# EasyEDA Pro project ProPrj_TMI7003C_TEST—CHANGE_2025-05-07.epro

# Schematic Schematic1

## Sheets
1 P2: Board Name: Board1; Create Date: 2025-05-06; Page Name: P2; Project Name: TMI7003C_TEST—CHANGE; Schematic Name: Schematic1; Update Date: 2025-05-06; Company: 嘉立创EDA; Page Size: A4; Version: V1.0
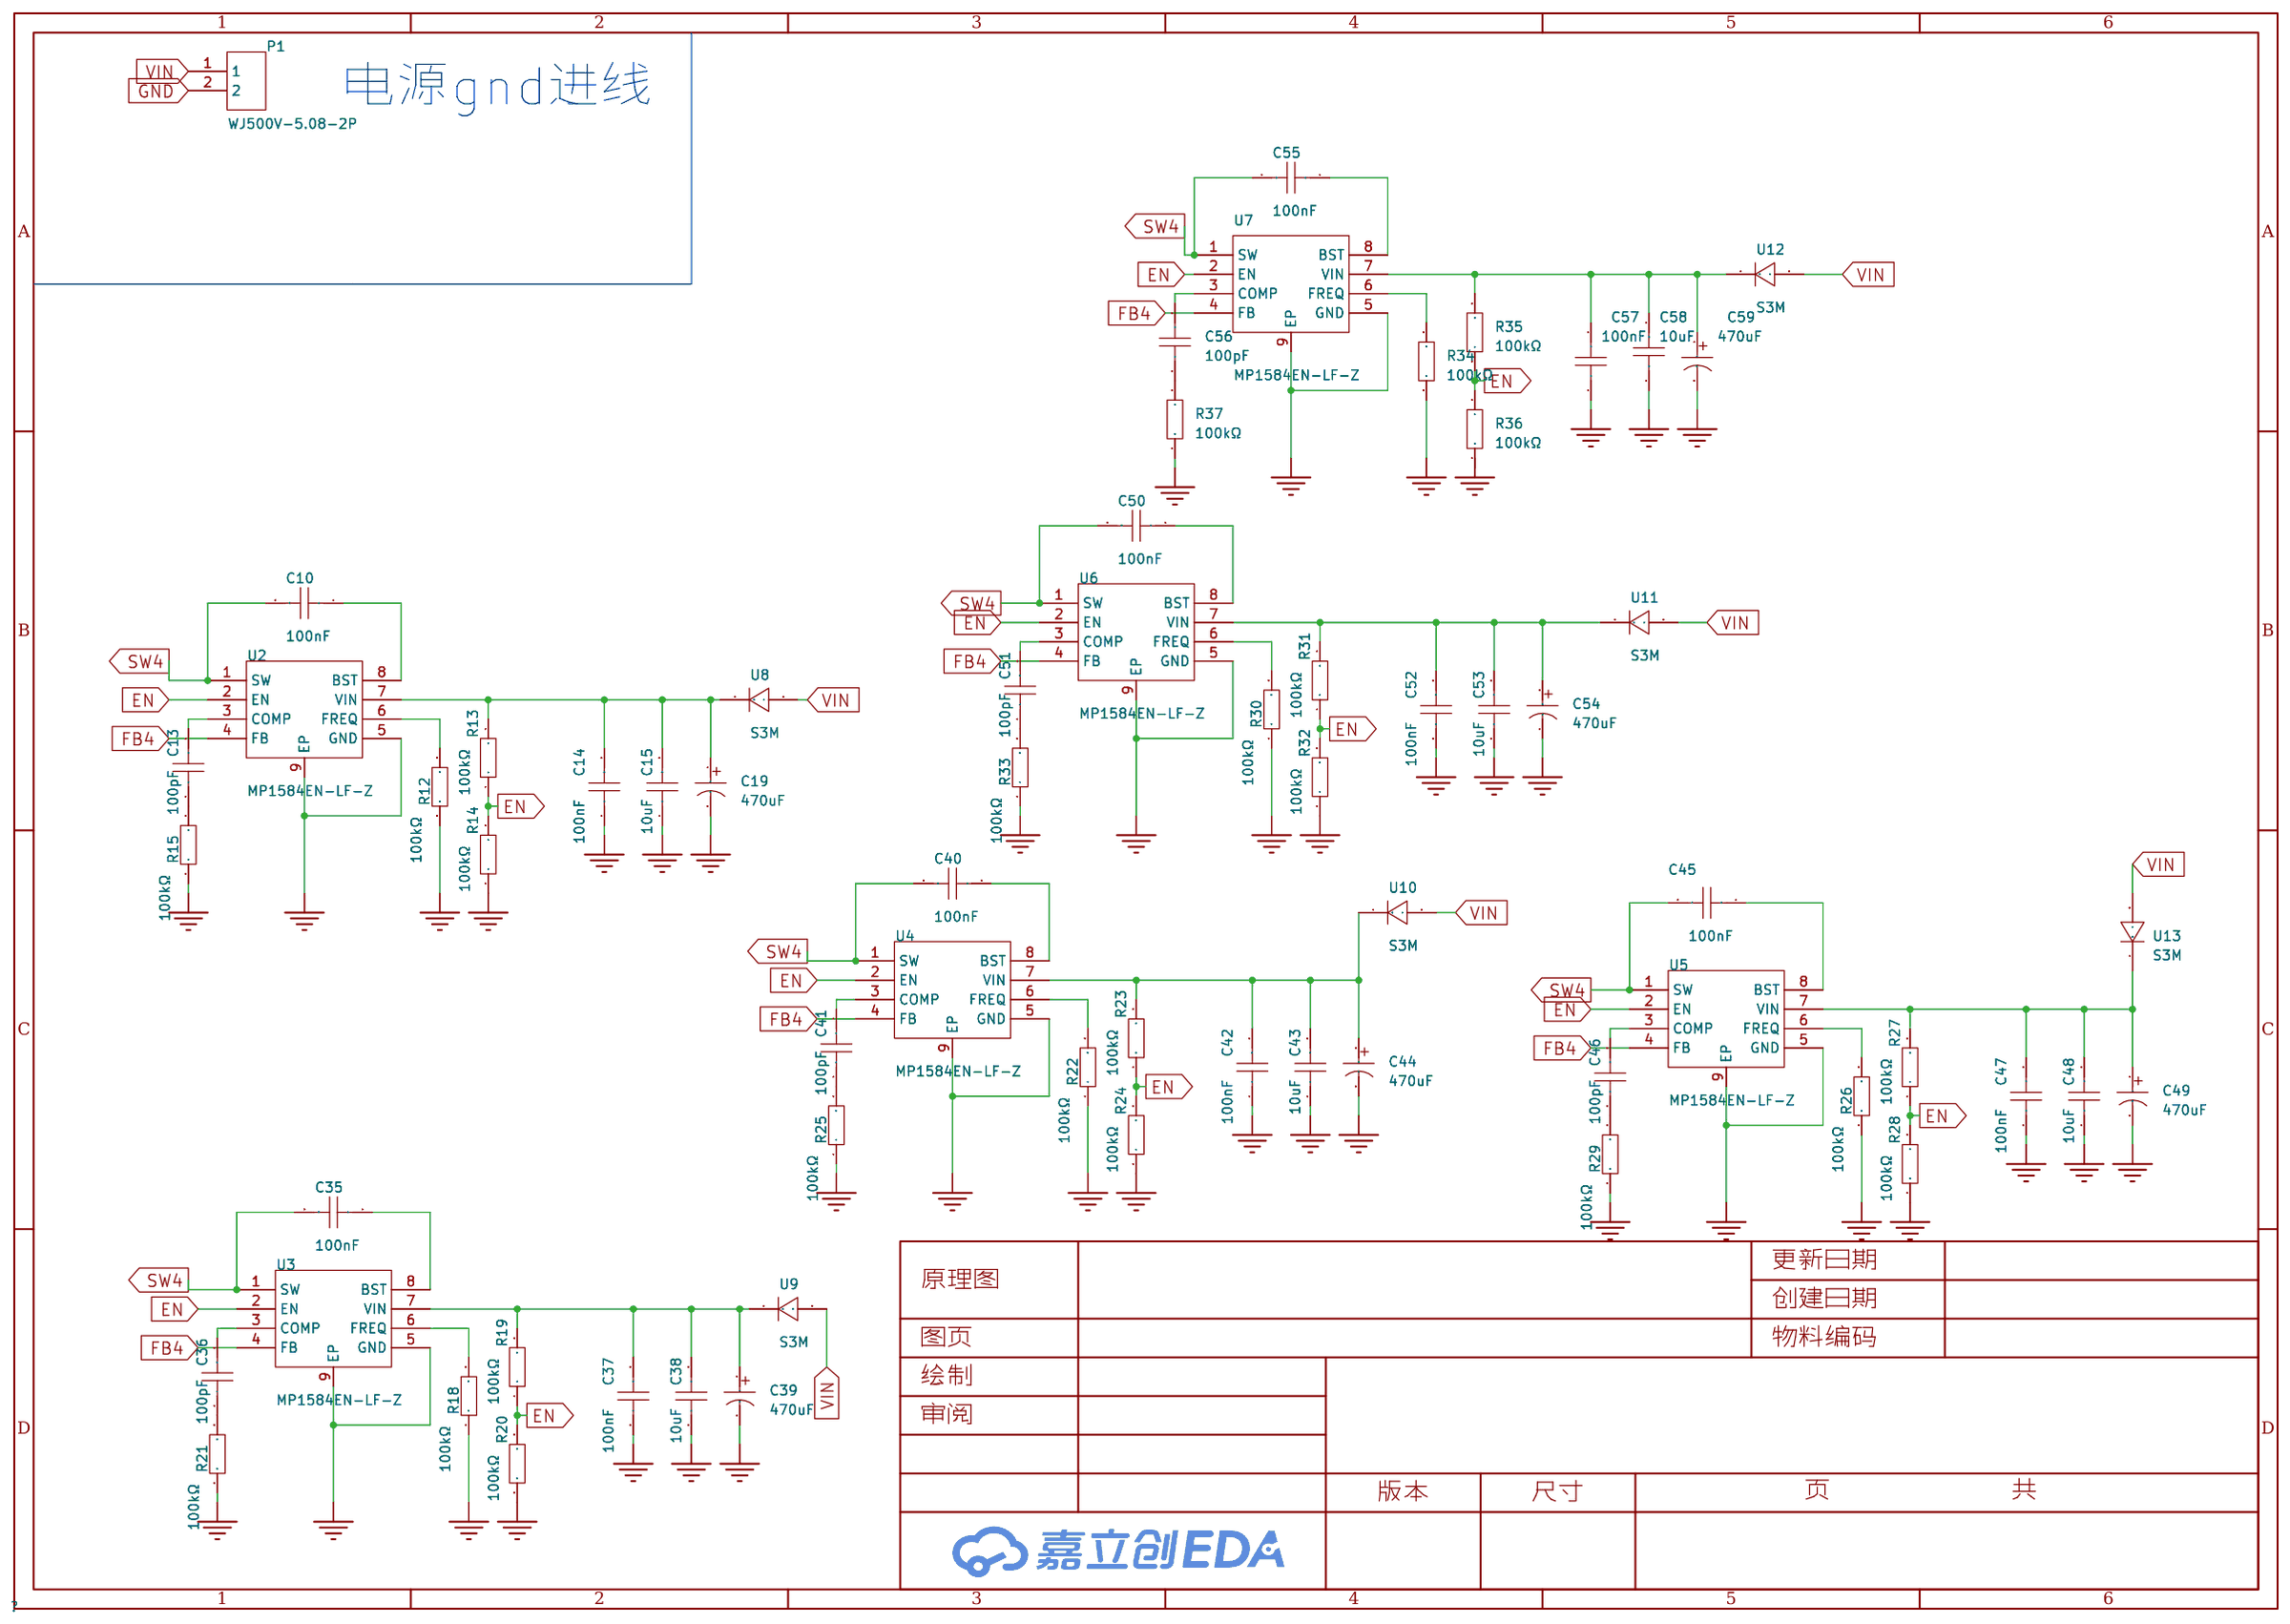
[diagram p0: P2]
2 P3: Page Name: P3
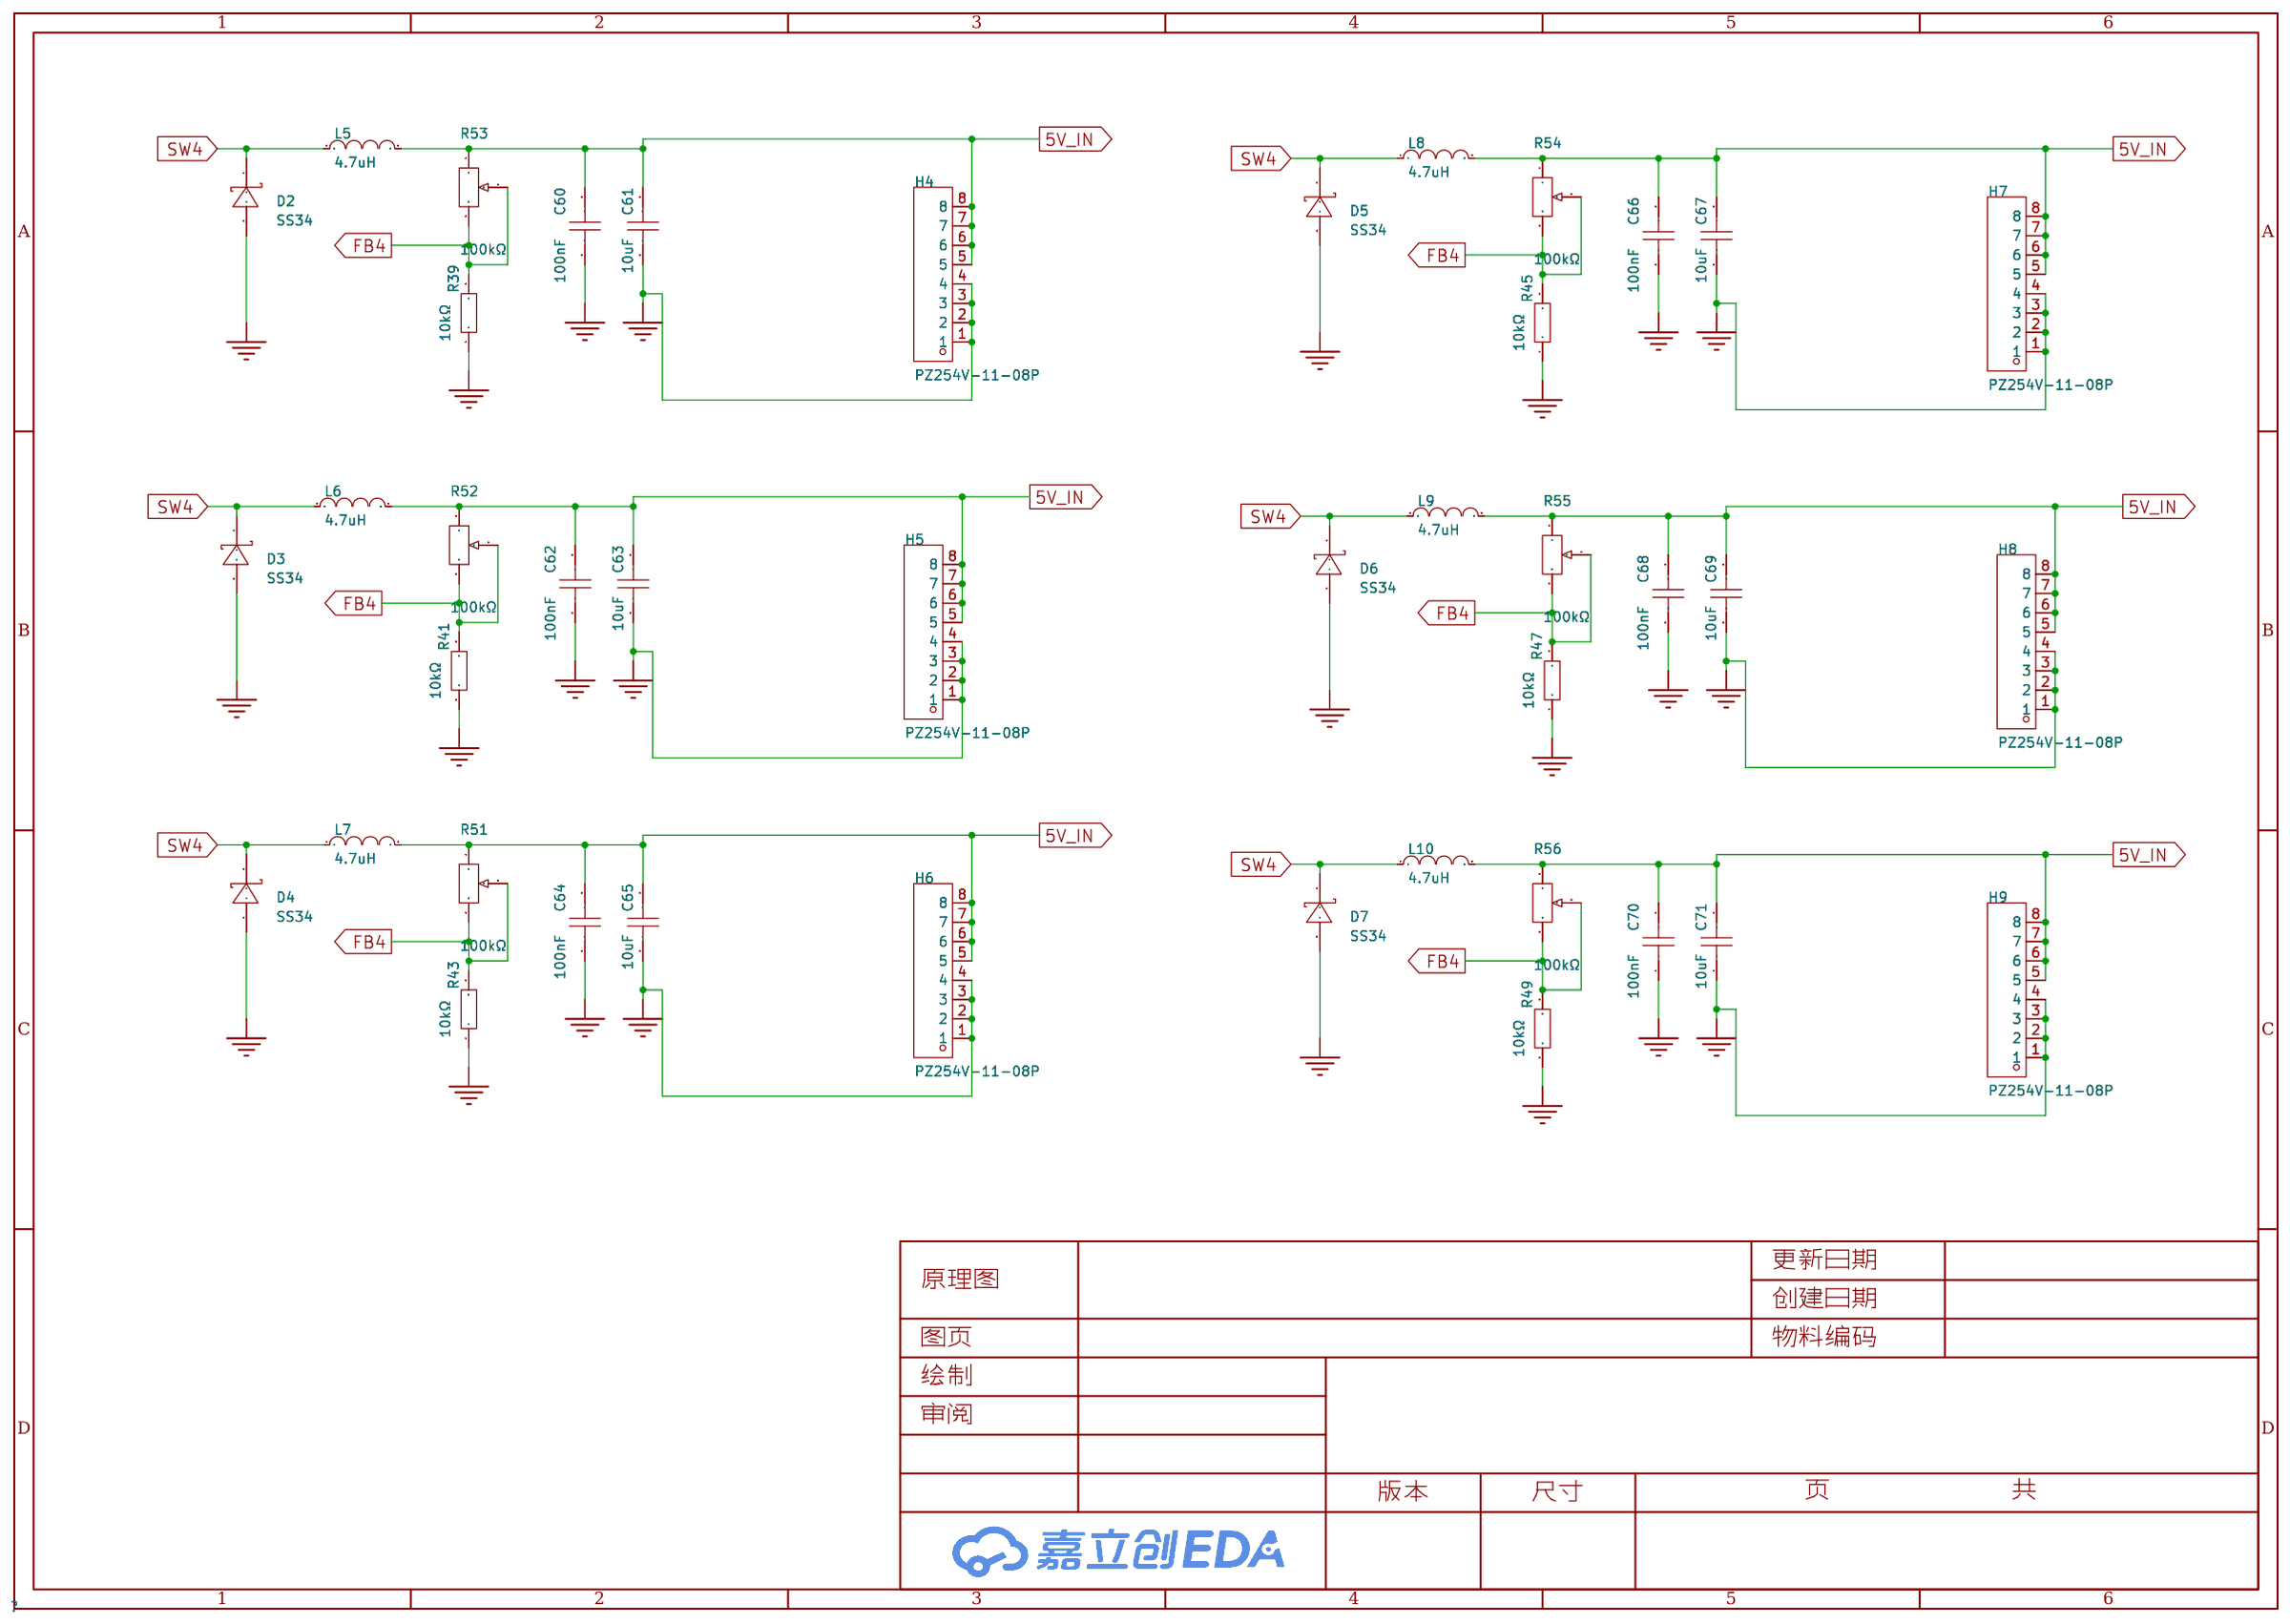
[diagram p1: P3]

## Parts
sheet P2
C10  100nF  [C0603]
C13  100pF  [C0603]
C14  100nF  [C0603]
C15  10uF  [C0603]
C19  470uF  [CAP-TH_BD10.0-P5.00-D1.0-FD]
C35  100nF  [C0603]
C36  100pF  [C0603]
C37  100nF  [C0603]
C38  10uF  [C0603]
C39  470uF  [CAP-TH_BD10.0-P5.00-D1.0-FD]
C40  100nF  [C0603]
C41  100pF  [C0603]
C42  100nF  [C0603]
C43  10uF  [C0603]
C44  470uF  [CAP-TH_BD10.0-P5.00-D1.0-FD]
C45  100nF  [C0603]
C46  100pF  [C0603]
C47  100nF  [C0603]
C48  10uF  [C0603]
C49  470uF  [CAP-TH_BD10.0-P5.00-D1.0-FD]
C50  100nF  [C0603]
C51  100pF  [C0603]
C52  100nF  [C0603]
C53  10uF  [C0603]
C54  470uF  [CAP-TH_BD10.0-P5.00-D1.0-FD]
C55  100nF  [C0603]
C56  100pF  [C0603]
C57  100nF  [C0603]
C58  10uF  [C0603]
C59  470uF  [CAP-TH_BD10.0-P5.00-D1.0-FD]
P1  WJ500V-5.08-2P  [CONN-TH_2P-P5.00_WJ500V-5.08-2P]
R12  100kΩ  [R0603]
R13  100kΩ  [R0603]
R14  100kΩ  [R0603]
R15  100kΩ  [R0603]
R18  100kΩ  [R0603]
R19  100kΩ  [R0603]
R20  100kΩ  [R0603]
R21  100kΩ  [R0603]
R22  100kΩ  [R0603]
R23  100kΩ  [R0603]
R24  100kΩ  [R0603]
R25  100kΩ  [R0603]
R26  100kΩ  [R0603]
R27  100kΩ  [R0603]
R28  100kΩ  [R0603]
R29  100kΩ  [R0603]
R30  100kΩ  [R0603]
R31  100kΩ  [R0603]
R32  100kΩ  [R0603]
R33  100kΩ  [R0603]
R34  100kΩ  [R0603]
R35  100kΩ  [R0603]
R36  100kΩ  [R0603]
R37  100kΩ  [R0603]
U2  MP1584EN-LF-Z  [SOIC-8_L5.0-W4.0-P1.27-LS6.0-BL-EP2.0]
U3  MP1584EN-LF-Z  [SOIC-8_L5.0-W4.0-P1.27-LS6.0-BL-EP2.0]
U4  MP1584EN-LF-Z  [SOIC-8_L5.0-W4.0-P1.27-LS6.0-BL-EP2.0]
U5  MP1584EN-LF-Z  [SOIC-8_L5.0-W4.0-P1.27-LS6.0-BL-EP2.0]
U6  MP1584EN-LF-Z  [SOIC-8_L5.0-W4.0-P1.27-LS6.0-BL-EP2.0]
U7  MP1584EN-LF-Z  [SOIC-8_L5.0-W4.0-P1.27-LS6.0-BL-EP2.0]
U8  S3M  [SMB_L4.3-W3.6-LS5.3-RD]
U9  S3M  [SMB_L4.3-W3.6-LS5.3-RD]
U10  S3M  [SMB_L4.3-W3.6-LS5.3-RD]
U11  S3M  [SMB_L4.3-W3.6-LS5.3-RD]
U12  S3M  [SMB_L4.3-W3.6-LS5.3-RD]
U13  S3M  [SMB_L4.3-W3.6-LS5.3-RD]
sheet P3
C60  100nF  [C0603]
C61  10uF  [C0603]
C62  100nF  [C0603]
C63  10uF  [C0603]
C64  100nF  [C0603]
C65  10uF  [C0603]
C66  100nF  [C0603]
C67  10uF  [C0603]
C68  100nF  [C0603]
C69  10uF  [C0603]
C70  100nF  [C0603]
C71  10uF  [C0603]
D2  SS34  [SMA_L4.3-W2.6-LS5.2-RD]
D3  SS34  [SMA_L4.3-W2.6-LS5.2-RD]
D4  SS34  [SMA_L4.3-W2.6-LS5.2-RD]
D5  SS34  [SMA_L4.3-W2.6-LS5.2-RD]
D6  SS34  [SMA_L4.3-W2.6-LS5.2-RD]
D7  SS34  [SMA_L4.3-W2.6-LS5.2-RD]
H4  PZ254V-11-08P  [HDR-TH_8P-P2.54-V-M]
H5  PZ254V-11-08P  [HDR-TH_8P-P2.54-V-M]
H6  PZ254V-11-08P  [HDR-TH_8P-P2.54-V-M]
H7  PZ254V-11-08P  [HDR-TH_8P-P2.54-V-M]
H8  PZ254V-11-08P  [HDR-TH_8P-P2.54-V-M]
H9  PZ254V-11-08P  [HDR-TH_8P-P2.54-V-M]
L5  4.7uH  [IND-SMD_L5.4-W5.2_FXL0530]
L6  4.7uH  [IND-SMD_L5.4-W5.2_FXL0530]
L7  4.7uH  [IND-SMD_L5.4-W5.2_FXL0530]
L8  4.7uH  [IND-SMD_L5.4-W5.2_FXL0530]
L9  4.7uH  [IND-SMD_L5.4-W5.2_FXL0530]
L10  4.7uH  [IND-SMD_L5.4-W5.2_FXL0530]
R39  10kΩ  [R0603]
R41  10kΩ  [R0603]
R43  10kΩ  [R0603]
R45  10kΩ  [R0603]
R47  10kΩ  [R0603]
R49  10kΩ  [R0603]
R51  100kΩ  [RES-ADJ-TH_3P-L9.5-W4.9-P2.50-L_3296W]
R52  100kΩ  [RES-ADJ-TH_3P-L9.5-W4.9-P2.50-L_3296W]
R53  100kΩ  [RES-ADJ-TH_3P-L9.5-W4.9-P2.50-L_3296W]
R54  100kΩ  [RES-ADJ-TH_3P-L9.5-W4.9-P2.50-L_3296W]
R55  100kΩ  [RES-ADJ-TH_3P-L9.5-W4.9-P2.50-L_3296W]
R56  100kΩ  [RES-ADJ-TH_3P-L9.5-W4.9-P2.50-L_3296W]

## Library data of the parts
C10 C14 C35 C37 C40 C42 C45 C47 C50 C52 C55 C57 C60 C62 C64 C66 C68 C70 = CGA0603X7R104K500JT: 容值:100nF;精度:±10%;额定电压:50V;材质(温度系数):X7R;; LCSC Part Name: 100nF ±10% 50V; Supplier Part: C6119867; Manufacturer: HRE(芯声); Supplier Footprint: 0603; JLCPCB Part Class: 扩展库; Supplier: LCSC; Tolerance: ±10%; Voltage Rated: 50V; Temperature Coefficient: X7R
C13 C36 C41 C46 C51 C56 = CC0603JRNPO9BN101: 容值:100pF;精度:±5%;额定电压:50V;材质(温度系数):NP0;; LCSC Part Name: 100pF ±5% 50V; Supplier Part: C14665; Manufacturer: YAGEO(国巨); Supplier Footprint: 0603; JLCPCB Part Class: 扩展库; Datasheet: https://atta.szlcsc.com/upload/public/pdf/source/20181008/C309499_21CC21451B82C39E3D92150FD6B30293.pdf; Supplier: LCSC; Tolerance: ±5%; Voltage Rated: 50V; Temperature Coefficient: NP0
C15 C38 C43 C48 C53 C58 C61 C63 C65 C67 C69 C71 = CGA0603X5R106K100JT: 容值:10uF;精度:±10%;额定电压:10V;材质(温度系数):X5R;; LCSC Part Name: 10uF ±10% 10V; Supplier Part: C6119842; Manufacturer: HRE(芯声); Supplier Footprint: 0603; JLCPCB Part Class: 扩展库; Supplier: LCSC; Tolerance: ±10%; Voltage Rated: 10V; Temperature Coefficient: X5R
C19 C39 C44 C49 C54 C59 = ERS1VM471G16OT: 容值:470uF;精度:±20%;额定电压:35V;; LCSC Part Name: 470uF ±20% 35V; Supplier Part: C106703; Manufacturer: AISHI(艾华集团); Supplier Footprint: 插件,D10xL16mm; JLCPCB Part Class: 扩展库; Datasheet: https://atta.szlcsc.com/upload/public/pdf/source/20191015/C438940_4B8E60A742BB0AE40DDEF87A5C89089D.pdf; Supplier: LCSC; Tolerance: ±20%; Voltage Rating: 35V; Pin Spacing: 5mm; Diameter: 10mm; Height - Seated (Max): 16mm; Lifetime: 7000hrs@105℃
P1 = WJ500V-5.08-2P: 结构:1x2P;间距:5.08mm;颜色:绿色;安装方式:直插;额定电流:18A;额定电压:250V;排数:1;线规 - AWG:14~30;线规 - 平方毫米:2.5;每排PIN数:2;触头材质:-;触头镀层:-;工作温度范围:-40℃~+105℃;焊接温度(最大值):-;; LCSC Part Name: 1x2P 5.08mm 直插 排数:1 每排P数:2; Supplier Part: C8465; Manufacturer: KANGNEX(康奈克斯电气); Supplier Footprint: 插件,P=5.08mm; JLCPCB Part Class: 扩展库; Datasheet: https://atta.szlcsc.com/upload/public/pdf/source/20191225/C8465_02D34CE5B5B4A53DF5891601D97FA9F4.pdf; Supplier: LCSC; Structure: 1x2P; Pitch: 5.08mm; Color: 绿色; Mounting Style: 直插; Current Rating (Max): 18A; Voltage Rating (Max): 250V; Number of Pins: 2P; Number of Rows: 1; Wire Gauge - AWG: 14~30; Wire Gauge - mm2: 2.5; Number of PINs Per Row: 2; Operating Temperature Range: -40℃~+105℃; Screw Specification: M2.5
R12-R15 R18-R37 R39 R41 R43 R45 R47 R49 = 0603WAF1003T5E: 电阻类型:厚膜电阻;阻值:100kΩ;精度:±1%;功率:100mW;最大工作电压:75V;温度系数:±100ppm/℃;; LCSC Part Name: 100kΩ ±1% 100mW 厚膜电阻; Supplier Part: C25803; Manufacturer: UNI-ROYAL(厚声); Supplier Footprint: 0603; JLCPCB Part Class: 基础库; Datasheet: https://atta.szlcsc.com/upload/public/pdf/source/20200306/C422600_1E6D84923E4A46A82E41ADD87F860B5C.pdf; Supplier: LCSC; Type: 厚膜电阻; Tolerance: ±1%; Power(Watts): 100mW; Overload Voltage (Max): 75V; Temperature Coefficient: ±100ppm/℃; Operating Temperature Range: -55℃~+155℃
U2-U7 = MP1584EN-LF-Z: 功能类型:降压型;输出类型:固定;工作电压:4.5V~28V;输出电压:800mV~25V;输出电流:3A;; LCSC Part Name: 3A、1.5MHz、28V降压转换器; Supplier Part: C15051; Manufacturer: MPS(芯源); Supplier Footprint: SOIC-8-EP; JLCPCB Part Class: 扩展库; Datasheet: https://atta.szlcsc.com/upload/public/pdf/source/20240315/437CA6FCECC7F1E554266F7D3B71CA0D.pdf; Supplier: LCSC; Function: 降压型; Output Type: 固定; Input Voltage: 4.5V~28V; Output Voltage: 800mV~25V; Output Current: 3A; Switching Frequency: 100kHz~1.5MHz; Operating Temperature: -20℃~+125℃; Synchronous Rectification: 否; Number of Outputs: 1; Topology: 降压式; Quiescent Current (Iq): 100uA; Switch tube (built-in/external): 内置
U8-U13 = S3M_C5204901: 二极管配置:独立式;正向压降(Vf):1.1V@3A;直流反向耐压(Vr):1kV;整流电流:3A;; Supplier Part: C5204901; Manufacturer: TWGMC(台湾迪嘉); Supplier Footprint: SMB; JLCPCB Part Class: 扩展库; Datasheet: https://atta.szlcsc.com/upload/public/pdf/source/20221031/21978DBEFD3E170414161A278DB5CF20.pdf; Supplier: LCSC; Diode Configuration: 独立式; Forward Voltage (Vf@If): 1.1V@3A; Reverse Voltage (Vr): 1kV; Rectified Current: 3A; Reverse Leakage Current (Ir): 5uA
D2-D7 = SS34_C8678: 二极管配置:独立式;正向压降(Vf):550mV@3A;直流反向耐压(Vr):40V;整流电流:3A;; LCSC Part Name: 电压:40V 电流:3A; Supplier Part: C8678; Manufacturer: MDD(辰达半导体); Supplier Footprint: SMA(DO-214AC); JLCPCB Part Class: 基础库; Datasheet: https://atta.szlcsc.com/upload/public/pdf/source/20240710/2118BB86FDDB2E0B294389AC1F3F65C8.pdf; Supplier: LCSC; Diode Configuration: 独立式; Forward Voltage (Vf@If): 550mV@3A; Reverse Voltage (Vr): 40V; Rectified Current: 3A; Reverse Leakage Current (Ir): 500uA@40V
H4-H9 = PZ254V-11-08P: 插针结构:1x8P;间距:2.54mm;行距:-;圆针/方针:方针;安装类型:直插;排数:单排;总PIN位数:8P;额定电流:-;额定电压:-;配合针长度:6mm;塑高:2.5mm;端接针长度:3mm;触头材质:黄铜;触头镀层:-;工作温度范围:-40℃~+105℃;颜色:黑色;; LCSC Part Name: 间距:2.54mm 1x8P 直插 方针; Supplier Part: C492407; Manufacturer: XFCN(兴飞); Supplier Footprint: 插件,P=2.54mm; JLCPCB Part Class: 扩展库; Datasheet: https://atta.szlcsc.com/upload/public/pdf/source/20200309/C492407_83A6FB26A2233368EDB9516968EC6149.pdf; Supplier: LCSC; Pin Structure: 1x8P; Pitch: 2.54mm; Circluar Pins/Square Pins: 方针; Mounting Type: 直插; Number of Rows: 单排; Number of Pins: 8P; Length of Mating Pin: 6mm; Insulation Height: 2.5mm; Length of End Connection Pin: 3mm; Contact Material: 黄铜; Operating Temperature Range: -40℃~+105℃; Color: 黑色
L5-L10 = FXL0530-4R7-M: 电感值:4.7uH;精度:±20%;额定电流:4.5A;饱和电流(Isat):5A;类型:一体成型电感;; LCSC Part Name: 4.7uH ±20% 5A; Supplier Part: C177246; Manufacturer: cjiang(长江微电); Supplier Footprint: SMD,5.2x5.4mm; JLCPCB Part Class: 扩展库; Datasheet: https://atta.szlcsc.com/upload/public/pdf/source/20240426/3189EA8206330E2108542F9E34E540E7.pdf; Supplier: LCSC; Tolerance: ±20%; Rated Current: 4.5A; Saturation Current (Isat): 5A; DC Resistance (DCR): 60mΩ; Type: 一体成型电感
R51-R56 = 3296W-1-104: 阻值:100kΩ;精度:±10%;; LCSC Part Name: 100kΩ ±10%; Supplier Part: C118963; Manufacturer: BOCHEN(博晨); Supplier Footprint: 插件; JLCPCB Part Class: 扩展库; Datasheet: https://atta.szlcsc.com/upload/public/pdf/source/20171114/C118963_15106326662041117450.pdf; Supplier: LCSC; Tolerance: ±10%

## Nets
5V_IN: C60.2 C61.2 C62.2 C63.2 C64.2 C65.2 C66.2 C67.2 C68.2 C69.2 C70.2 C71.2 H4.5 H4.6 H4.7 H4.8 H5.5 H5.6 H5.7 H5.8 H6.5 H6.6 H6.7 H6.8 H7.5 H7.6 H7.7 H7.8 H8.5 H8.6 H8.7 H8.8 H9.5 H9.6 H9.7 H9.8 L5.2 L6.2 L7.2 L8.2 L9.2 L10.2 R51.1 R52.1 R53.1 R54.1 R55.1 R56.1
GND: C14.1 C15.1 C19.2 C37.1 C38.1 C39.2 C42.1 C43.1 C44.2 C47.1 C48.1 C49.2 C52.1 C53.1 C54.2 C57.1 C58.1 C59.2 C60.1 C61.1 C62.1 C63.1 C64.1 C65.1 C66.1 C67.1 C68.1 C69.1 C70.1 C71.1 D2.2(A) D3.2(A) D4.2(A) D5.2(A) D6.2(A) D7.2(A) H4.1 H4.2 H4.3 H4.4 H5.1 H5.2 H5.3 H5.4 H6.1 H6.2 H6.3 H6.4 H7.1 H7.2 H7.3 H7.4 H8.1 H8.2 H8.3 H8.4 H9.1 H9.2 H9.3 H9.4 P1.2 R12.1 R14.1 R15.1 R18.1 R20.1 R21.1 R22.1 R24.1 R25.1 R26.1 R28.1 R29.1 R30.1 R32.1 R33.1 R34.1 R36.1 R37.1 R39.1 R41.1 R43.1 R45.1 R47.1 R49.1 U2.5(GND) U2.9(EP) U3.5(GND) U3.9(EP) U4.5(GND) U4.9(EP) U5.5(GND) U5.9(EP) U6.5(GND) U6.9(EP) U7.5(GND) U7.9(EP)
VIN: C14.2 C15.2 C19.1 P1.1 R13.2 U2.7(VIN) U8.1(C) U8.2(A) U9.2(A) U10.2(A) U11.2(A) U12.2(A) U13.2(A)
EN: R13.1 R14.2 R19.1 R20.2 R23.1 R24.2 R27.1 R28.2 R31.1 R32.2 R35.1 R36.2 U2.2(EN) U3.2(EN) U4.2(EN) U5.2(EN) U6.2(EN) U7.2(EN)
FB4: R39.2 R41.2 R43.2 R45.2 R47.2 R49.2 R51.2 R51.3 R52.2 R52.3 R53.2 R53.3 R54.2 R54.3 R55.2 R55.3 R56.2 R56.3 U2.4(FB) U3.4(FB) U4.4(FB) U5.4(FB) U6.4(FB) U7.4(FB)
SW4: C10.2 C35.2 C40.2 C45.2 C50.2 C55.2 D2.1(K) D3.1(K) D4.1(K) D5.1(K) D6.1(K) D7.1(K) L5.1 L6.1 L7.1 L8.1 L9.1 L10.1 U2.1(SW) U3.1(SW) U4.1(SW) U5.1(SW) U6.1(SW) U7.1(SW)
$2N216: C10.1 U2.8(BST)
$2N507: R12.2 U2.6(FREQ)
$2N1682: C13.1 R15.2
$2N1720: C13.2 U2.3(COMP)
$2N9284: C35.1 U3.8(BST)
$2N9286: R18.2 U3.6(FREQ)
$2N9292: C36.1 R21.2
$2N9293: C36.2 U3.3(COMP)
$2N9832: C40.1 U4.8(BST)
$2N9834: R22.2 U4.6(FREQ)
$2N9840: C41.1 R25.2
$2N9841: C41.2 U4.3(COMP)
$2N10380: C45.1 U5.8(BST)
$2N10382: R26.2 U5.6(FREQ)
$2N10388: C46.1 R29.2
$2N10389: C46.2 U5.3(COMP)
$2N10928: C50.1 U6.8(BST)
$2N10930: R30.2 U6.6(FREQ)
$2N10936: C51.1 R33.2
$2N10937: C51.2 U6.3(COMP)
$2N11476: C55.1 U7.8(BST)
$2N11478: R34.2 U7.6(FREQ)
$2N11484: C56.1 R37.2
$2N11485: C56.2 U7.3(COMP)
Net-(C37-2): C37.2 C38.2 C39.1 R19.2 U3.7(VIN) U9.1(C)
Net-(C42-2): C42.2 C43.2 C44.1 R23.2 U4.7(VIN) U10.1(C)
Net-(C47-2): C47.2 C48.2 C49.1 R27.2 U5.7(VIN) U13.1(C)
Net-(C52-2): C52.2 C53.2 C54.1 R31.2 U6.7(VIN) U11.1(C)
Net-(C57-2): C57.2 C58.2 C59.1 R35.2 U7.7(VIN) U12.1(C)

## Notes on the sheets
sheet 1
- 电源gnd进线

# Board PCB1
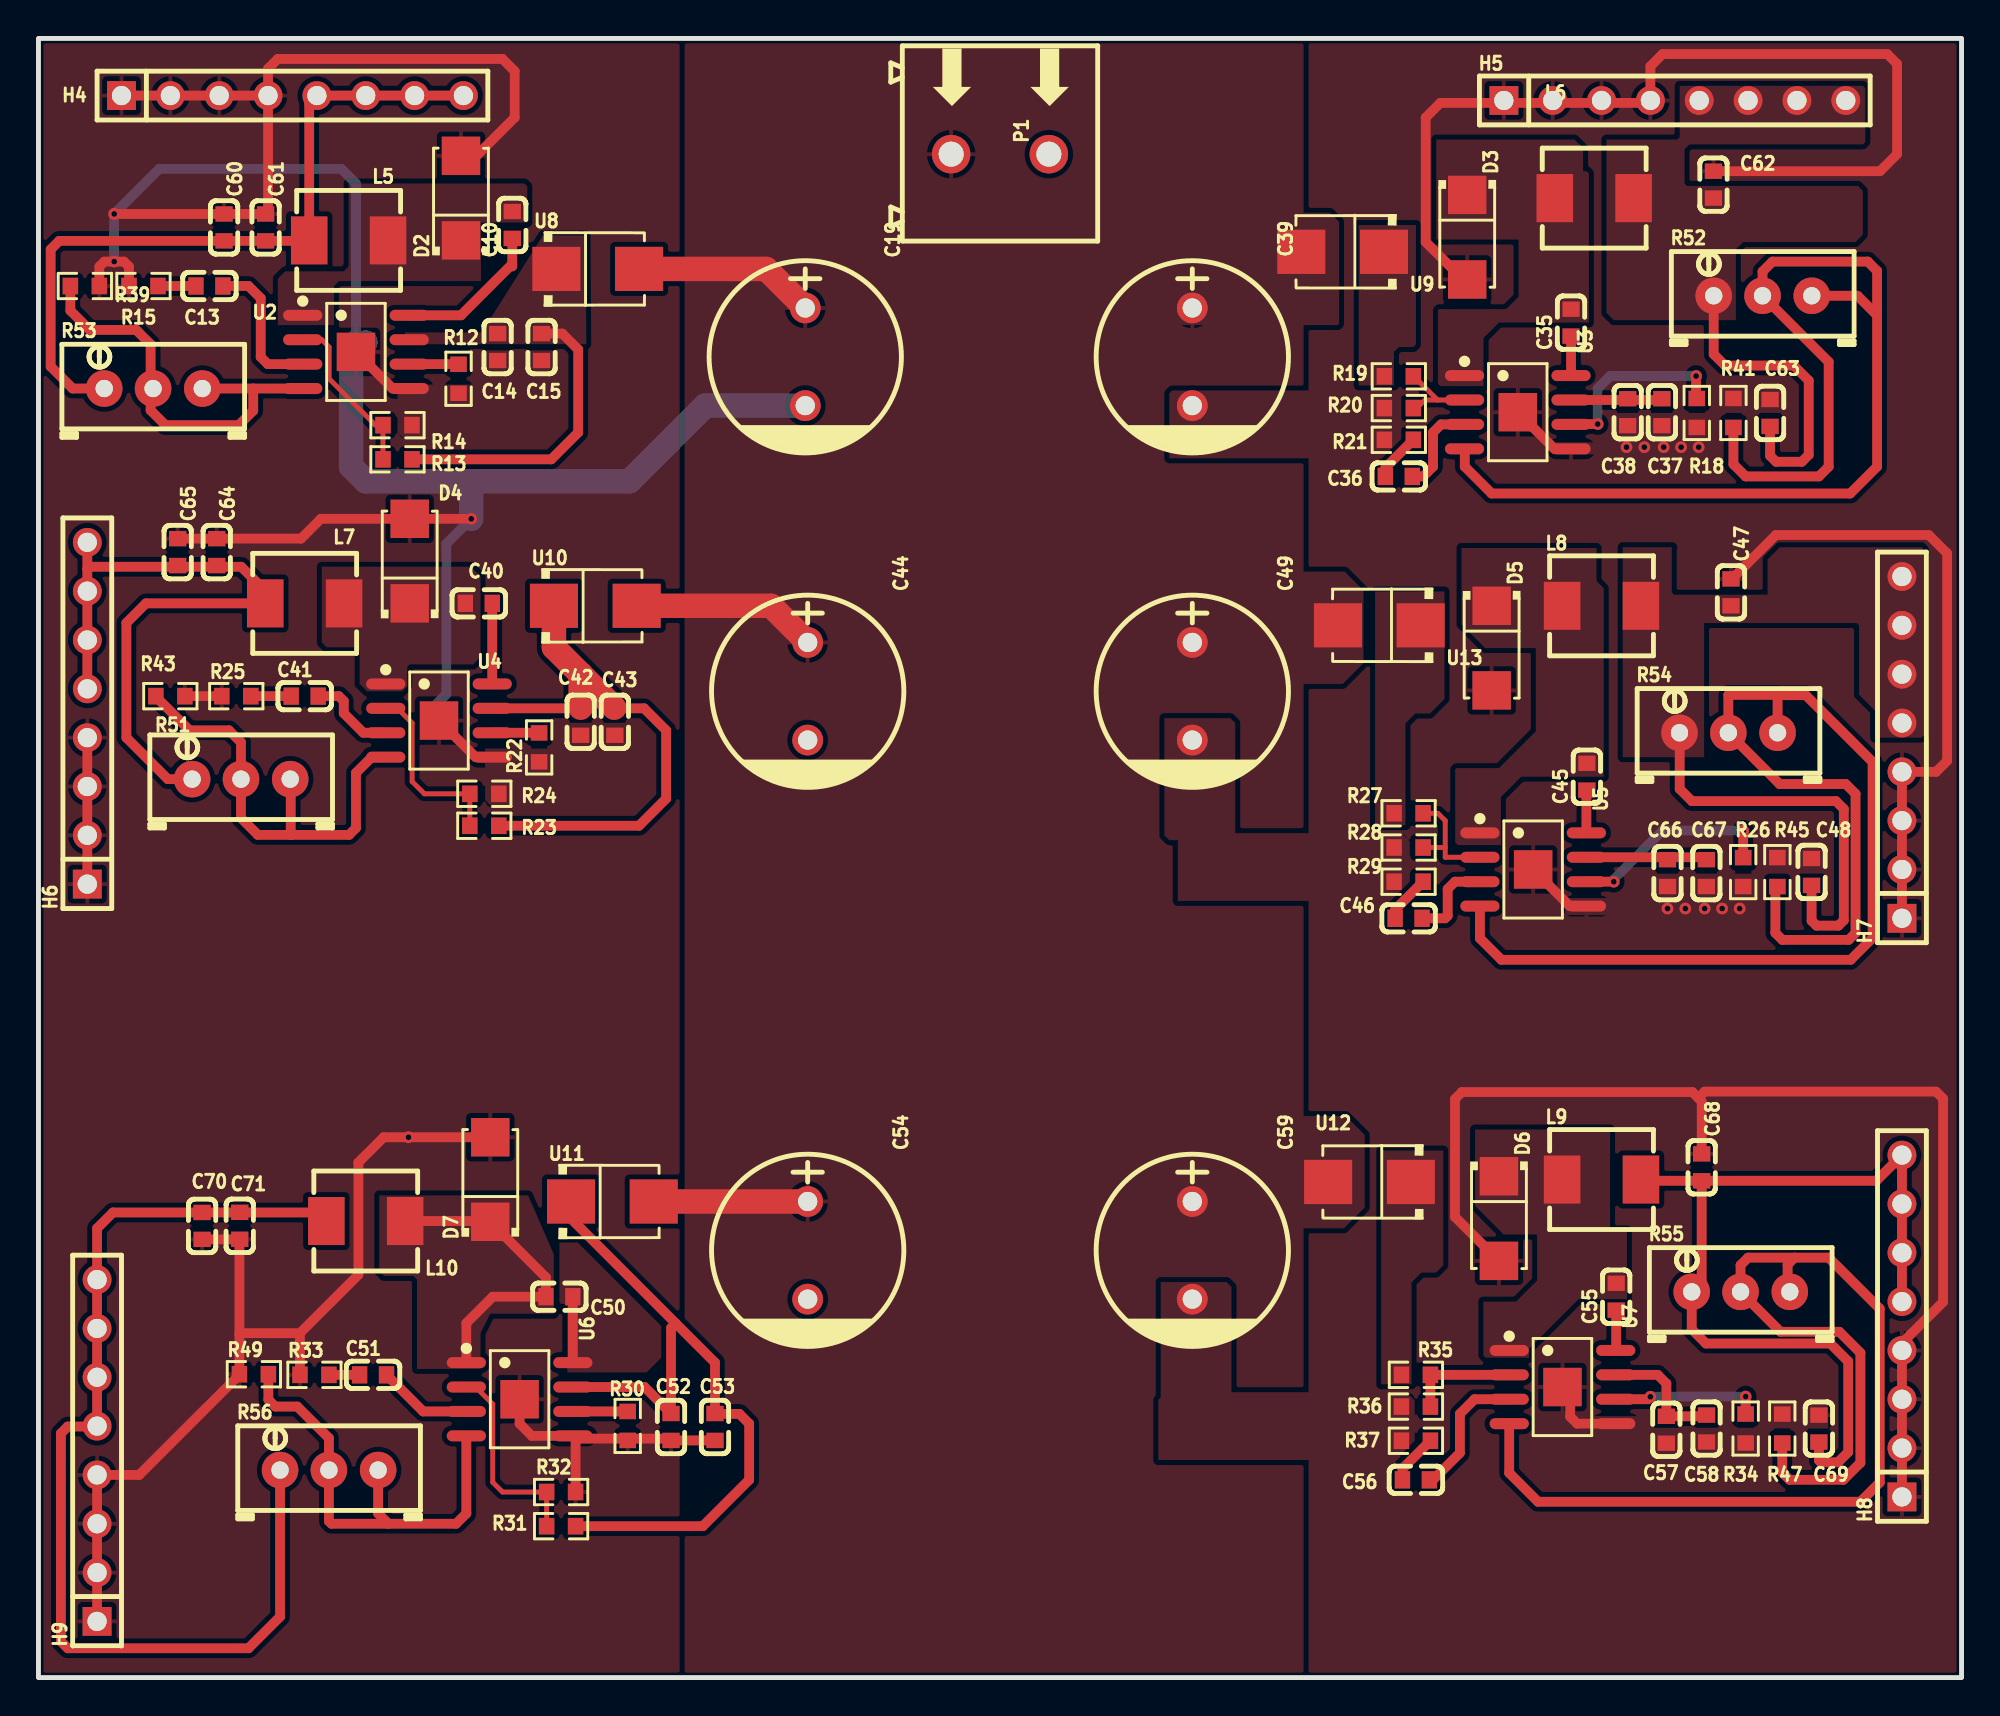
[diagram p2: board, top side]
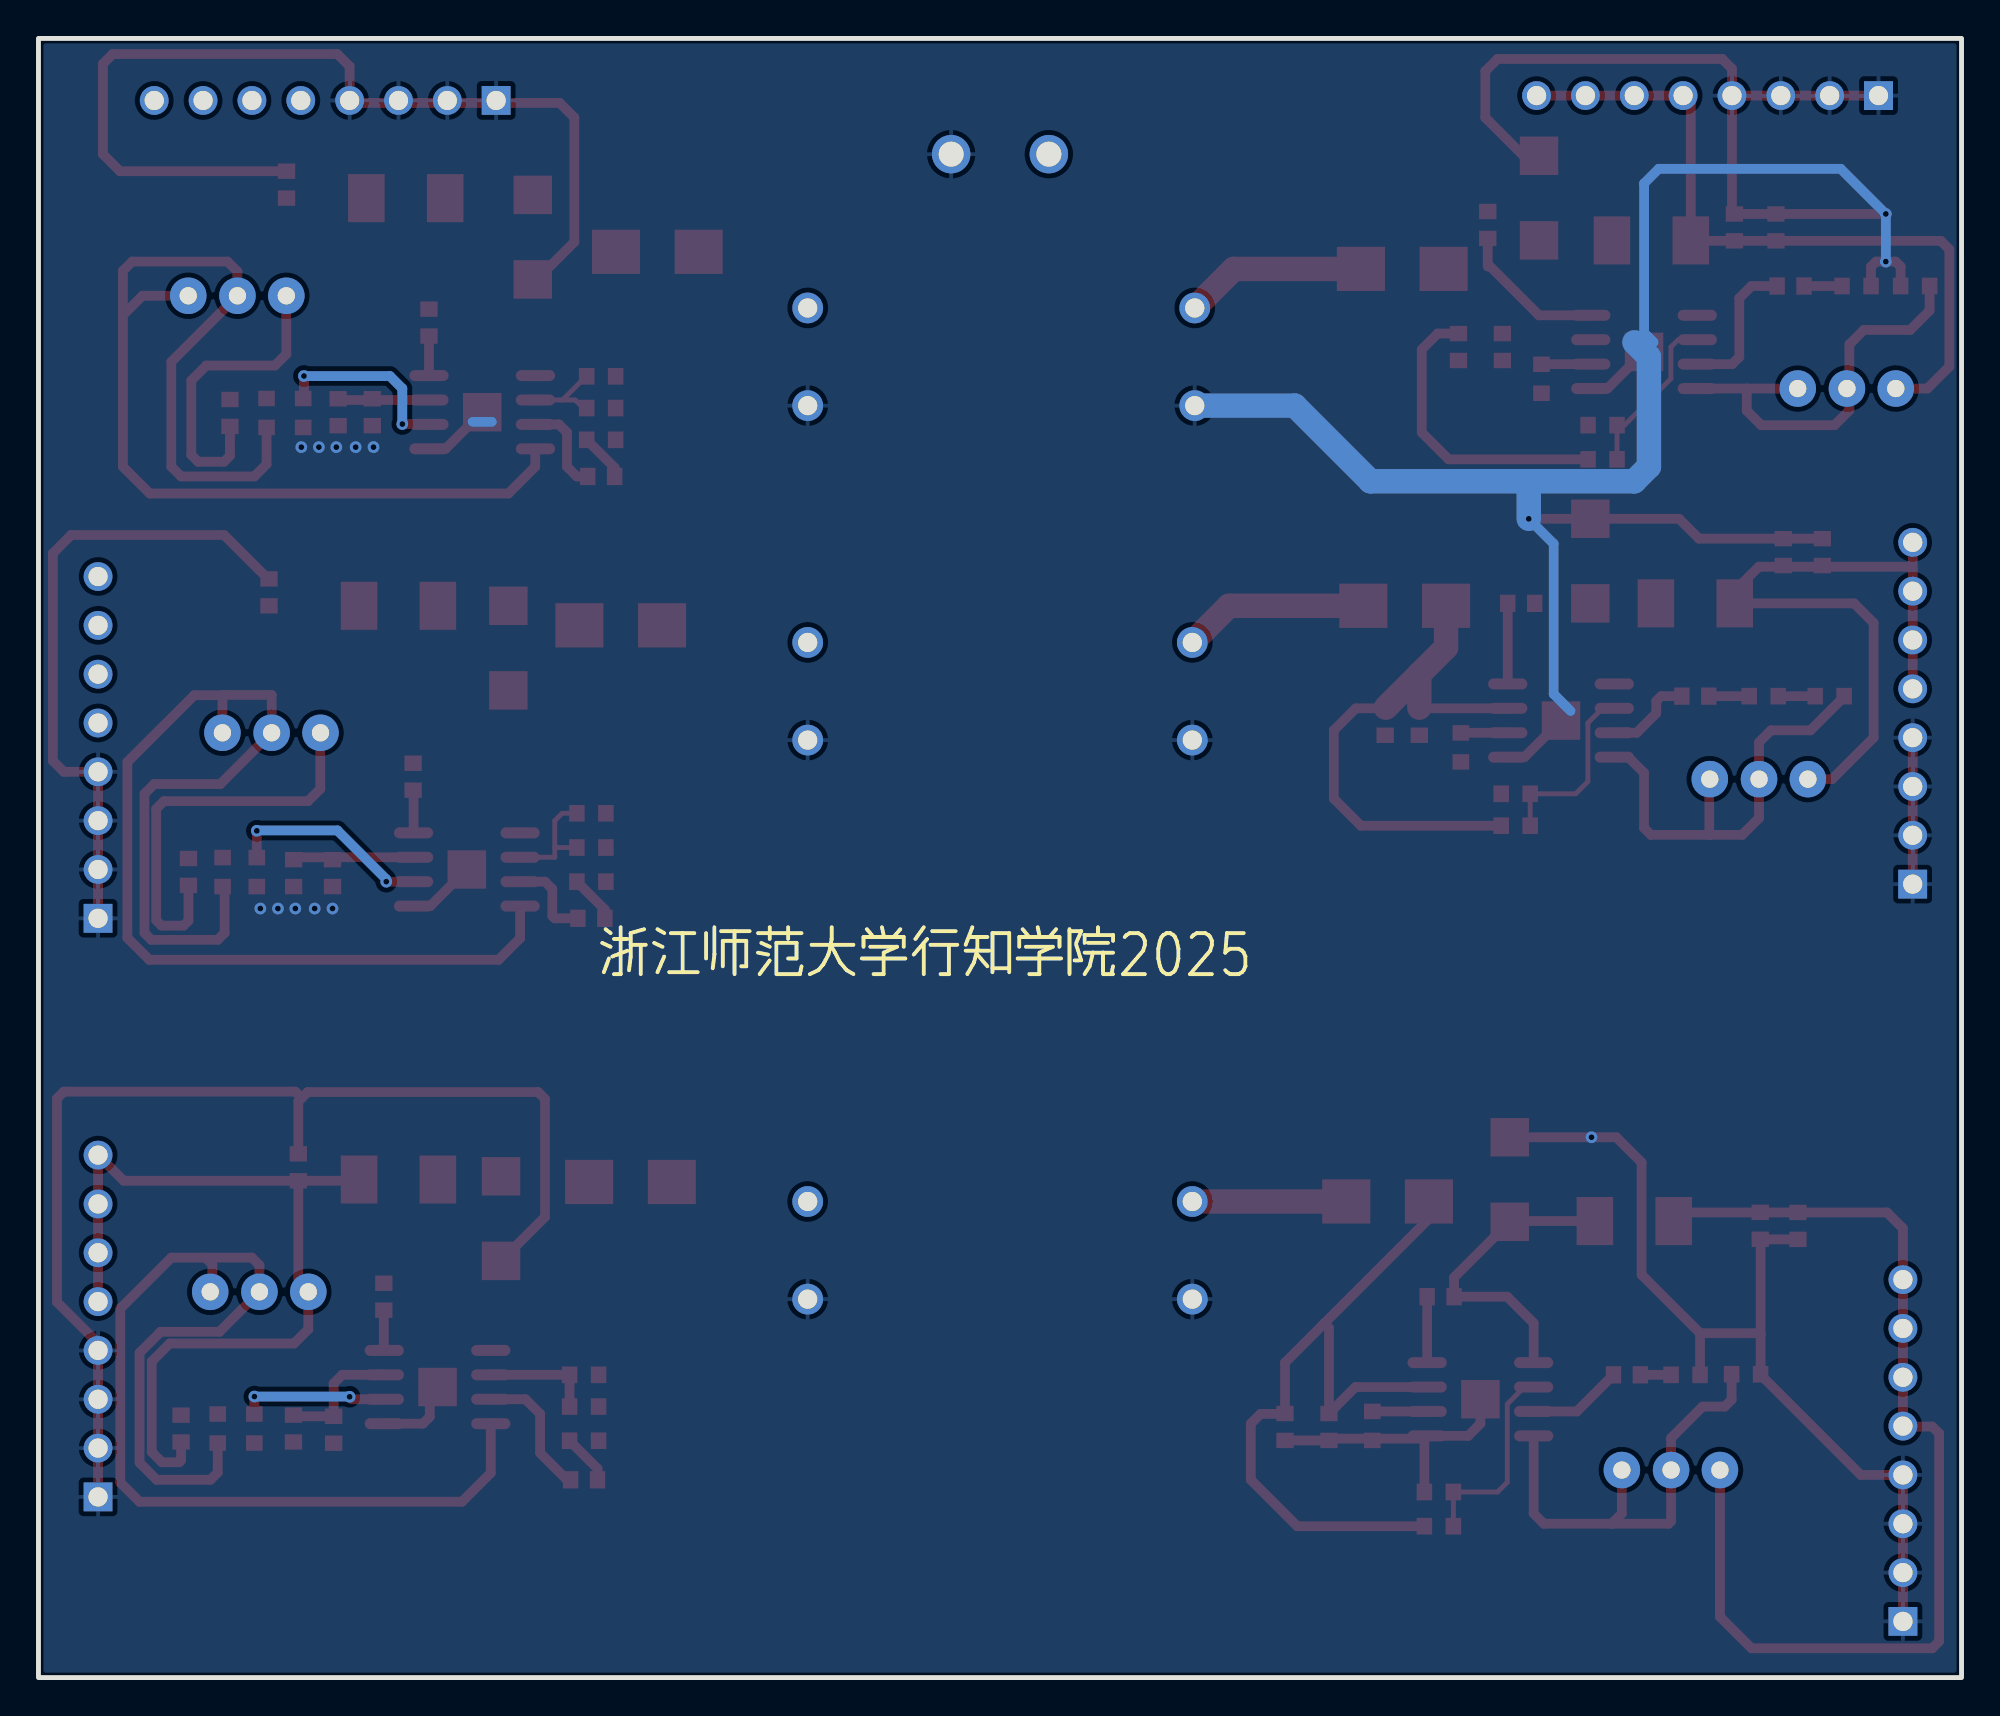
[diagram p3: board, bottom side, seen from below]

Outline 100 x 85.27 mm; copper layers: Top Layer, Bottom Layer. Coordinates in mm from the lower left corner of the outline.
Outline path: rectangle 0,85.27 100,0
Stack: Top Layer 0.035mm / Dielectric1 1.51mm FR4 er 4.5 / Bottom Layer 0.035mm

## Design rules (mm)
template: JLCPCB Capability(Two Layers Board)
spacing copperThickness1oz (default): track to track 0.102, other pairs 0.152 to 0.3
spacing copperThickness2oz: track to track 0.203, other pairs 0.152 to 0.3
track width copperThickness1oz (default): min 0.127, default 0.254, max 2.54
track width copperThickness2oz: min 0.203, default 0.254, max 2.54
differential pair differentialPair (default): width min 0.127, default 0.254, max 2.54; gap min 0.152, default 0.152
via viaSize (default): diameter min 0.5, default 0.61, max 10; hole min 0.3, default 0.305, max 6.3

## Placement (name value [footprint] x y rotation side)
C10  100nF  [C0603]  24.64 75.56 90 top
C13  100pF  [C0603]  8.89 72.39 0 top
C14  100nF  [C0603]  23.88 69.21 90 top
C15  10uF  [C0603]  26.16 69.21 90 top
C19  470uF  [CAP-TH_BD10.0-P5.00-D1.0-FD]  39.87 68.71 270 top
C35  100nF  [C0603]  79.69 70.48 90 top
C36  100pF  [C0603]  70.74 62.48 0 top
C37  100nF  [C0603]  84.42 65.82 90 top
C38  10uF  [C0603]  82.64 65.82 90 top
C39  470uF  [CAP-TH_BD10.0-P5.00-D1.0-FD]  60 68.71 270 top
C40  100nF  [C0603]  22.9 55.88 180 top
C41  100pF  [C0603]  13.84 51.05 0 top
C42  100nF  [C0603]  28.19 49.72 90 top
C43  10uF  [C0603]  29.97 49.72 90 top
C44  470uF  [CAP-TH_BD10.0-P5.00-D1.0-FD]  40 51.31 270 top
C45  100nF  [C0603]  80.52 46.86 90 top
C46  100pF  [C0603]  71.25 39.5 0 top
C47  100nF  [C0603]  88.01 56.45 270 top
C48  10uF  [C0603]  92.2 41.91 270 top
C49  470uF  [CAP-TH_BD10.0-P5.00-D1.0-FD]  60 51.31 270 top
C50  100nF  [C0603]  27.09 19.81 180 top
C51  100pF  [C0603]  17.4 15.75 0 top
C52  100nF  [C0603]  32.89 13.04 90 top
C53  10uF  [C0603]  35.18 13.04 90 top
C54  470uF  [CAP-TH_BD10.0-P5.00-D1.0-FD]  40 22.22 270 top
C55  100nF  [C0603]  82.04 19.81 90 top
C56  100pF  [C0603]  71.63 10.29 0 top
C57  100nF  [C0603]  84.65 12.89 90 top
C58  10uF  [C0603]  86.74 12.95 90 top
C59  470uF  [CAP-TH_BD10.0-P5.00-D1.0-FD]  60 22.22 270 top
C60  100nF  [C0603]  9.65 75.44 270 top
C61  10uF  [C0603]  11.81 75.44 270 top
C62  100nF  [C0603]  87.1 77.66 270 top
C63  10uF  [C0603]  90.04 65.79 270 top
C64  100nF  [C0603]  9.27 58.55 270 top
C65  10uF  [C0603]  7.24 58.55 270 top
C66  100nF  [C0603]  84.71 41.85 90 top
C67  10uF  [C0603]  86.73 41.85 90 top
C68  100nF  [C0603]  86.49 26.54 270 top
C69  10uF  [C0603]  92.58 12.95 270 top
C70  100nF  [C0603]  8.51 23.49 90 top
C71  10uF  [C0603]  10.47 23.5 90 top
D2  SS34  [SMA_L4.3-W2.6-LS5.2-RD]  21.97 76.96 90 top
D3  SS34  [SMA_L4.3-W2.6-LS5.2-RD]  74.29 74.93 270 top
D4  SS34  [SMA_L4.3-W2.6-LS5.2-RD]  19.3 58.08 90 top
D5  SS34  [SMA_L4.3-W2.6-LS5.2-RD]  75.56 53.55 270 top
D6  SS34  [SMA_L4.3-W2.6-LS5.2-RD]  75.95 23.88 270 top
D7  SS34  [SMA_L4.3-W2.6-LS5.2-RD]  23.5 25.91 90 top
H4  PZ254V-11-08P  [HDR-TH_8P-P2.54-V-M]  13.21 82.3 0 top
H5  PZ254V-11-08P  [HDR-TH_8P-P2.54-V-M]  85.09 82.04 0 top
H6  PZ254V-11-08P  [HDR-TH_8P-P2.54-V-M]  2.54 50.16 90 top
H7  PZ254V-11-08P  [HDR-TH_8P-P2.54-V-M]  96.9 48.39 90 top
H8  PZ254V-11-08P  [HDR-TH_8P-P2.54-V-M]  96.9 18.29 90 top
H9  PZ254V-11-08P  [HDR-TH_8P-P2.54-V-M]  3.05 11.81 90 top
L5  4.7uH  [IND-SMD_L5.4-W5.2_FXL0530]  16.13 74.76 180 top
L6  4.7uH  [IND-SMD_L5.4-W5.2_FXL0530]  80.9 76.96 0 top
L7  4.7uH  [IND-SMD_L5.4-W5.2_FXL0530]  13.84 55.88 180 top
L8  4.7uH  [IND-SMD_L5.4-W5.2_FXL0530]  81.28 55.75 0 top
L9  4.7uH  [IND-SMD_L5.4-W5.2_FXL0530]  81.28 25.91 0 top
L10  4.7uH  [IND-SMD_L5.4-W5.2_FXL0530]  17.02 23.75 180 top
P1  WJ500V-5.08-2P  [CONN-TH_2P-P5.00_WJ500V-5.08-2P]  50 79.25 0 top
R12  100kΩ  [R0603]  21.84 67.56 90 top
R13  100kΩ  [R0603]  18.67 63.37 0 top
R14  100kΩ  [R0603]  18.67 65.15 180 top
R15  100kΩ  [R0603]  5.46 72.39 0 top
R18  100kΩ  [R0603]  86.23 65.79 90 top
R19  100kΩ  [R0603]  70.74 67.69 180 top
R20  100kΩ  [R0603]  70.74 66.04 0 top
R21  100kΩ  [R0603]  70.74 64.39 0 top
R22  100kΩ  [R0603]  26.03 48.39 90 top
R23  100kΩ  [R0603]  23.18 44.31 0 top
R24  100kΩ  [R0603]  23.18 45.97 180 top
R25  100kΩ  [R0603]  10.29 51.05 0 top
R26  100kΩ  [R0603]  88.65 41.9 90 top
R27  100kΩ  [R0603]  71.25 44.96 180 top
R28  100kΩ  [R0603]  71.25 43.18 0 top
R29  100kΩ  [R0603]  71.25 41.4 0 top
R30  100kΩ  [R0603]  30.64 13.09 90 top
R31  100kΩ  [R0603]  27.18 7.87 0 top
R32  100kΩ  [R0603]  27.18 9.65 180 top
R33  100kΩ  [R0603]  14.35 15.75 0 top
R34  100kΩ  [R0603]  88.77 12.95 90 top
R35  100kΩ  [R0603]  71.63 15.75 180 top
R36  100kΩ  [R0603]  71.63 14.1 0 top
R37  100kΩ  [R0603]  71.63 12.32 0 top
R39  10kΩ  [R0603]  2.41 72.39 180 top
R41  10kΩ  [R0603]  88.14 65.79 270 top
R43  10kΩ  [R0603]  6.86 51.05 180 top
R45  10kΩ  [R0603]  90.42 41.9 270 top
R47  10kΩ  [R0603]  90.68 12.95 270 top
R49  10kΩ  [R0603]  11.2 15.78 0 top
R51  100kΩ  [RES-ADJ-TH_3P-L9.5-W4.9-P2.50-L_3296W]  10.54 46.74 0 top
R52  100kΩ  [RES-ADJ-TH_3P-L9.5-W4.9-P2.50-L_3296W]  89.66 71.88 0 top
R53  100kΩ  [RES-ADJ-TH_3P-L9.5-W4.9-P2.50-L_3296W]  5.97 67.06 0 top
R54  100kΩ  [RES-ADJ-TH_3P-L9.5-W4.9-P2.50-L_3296W]  87.88 49.15 0 top
R55  100kΩ  [RES-ADJ-TH_3P-L9.5-W4.9-P2.50-L_3296W]  88.52 20.07 0 top
R56  100kΩ  [RES-ADJ-TH_3P-L9.5-W4.9-P2.50-L_3296W]  15.11 10.79 0 top
U2  MP1584EN-LF-Z  [SOIC-8_L5.0-W4.0-P1.27-LS6.0-BL-EP2.0]  16.51 68.96 270 top
U3  MP1584EN-LF-Z  [SOIC-8_L5.0-W4.0-P1.27-LS6.0-BL-EP2.0]  76.92 65.82 270 top
U4  MP1584EN-LF-Z  [SOIC-8_L5.0-W4.0-P1.27-LS6.0-BL-EP2.0]  20.83 49.78 270 top
U5  MP1584EN-LF-Z  [SOIC-8_L5.0-W4.0-P1.27-LS6.0-BL-EP2.0]  77.72 42.04 270 top
U6  MP1584EN-LF-Z  [SOIC-8_L5.0-W4.0-P1.27-LS6.0-BL-EP2.0]  25.02 14.48 270 top
U7  MP1584EN-LF-Z  [SOIC-8_L5.0-W4.0-P1.27-LS6.0-BL-EP2.0]  79.25 15.11 270 top
U8  S3M  [SMB_L4.3-W3.6-LS5.3-RD]  29.08 73.28 0 top
U9  S3M  [SMB_L4.3-W3.6-LS5.3-RD]  67.82 74.17 180 top
U10  S3M  [SMB_L4.3-W3.6-LS5.3-RD]  28.96 55.75 0 top
U11  S3M  [SMB_L4.3-W3.6-LS5.3-RD]  29.84 24.76 0 top
U12  S3M  [SMB_L4.3-W3.6-LS5.3-RD]  69.22 25.78 180 top
U13  S3M  [SMB_L4.3-W3.6-LS5.3-RD]  69.72 54.74 180 top

## Footprints (pads in the part's own frame, mm; a bottom-side part is the same pattern mirrored in y, then rotated)
C0603
  rect 0.8x0.9 smd: 1(-0.7,0) 2(0.7,0)
CAP-TH_BD10.0-P5.00-D1.0-FD
  round 1.6 hole 1: 1(-2.54,0) 2(2.54,0)
CONN-TH_2P-P5.00_WJ500V-5.08-2P
  round 2 hole 1.3: 1(-2.54,0) 2(2.54,0)
HDR-TH_8P-P2.54-V-M
  rect 1.5x1.5 hole 1: 1(-8.89,0)
  round 1.5 hole 1: 2(-6.35,0) 3(-3.81,0) 4(-1.27,0) 5(1.27,0) 6(3.81,0) 7(6.35,0) 8(8.89,0)
IND-SMD_L5.4-W5.2_FXL0530
  rect 1.9x2.5 smd: 1(-2.05,0) 2(2.05,0)
R0603
  rect 0.806x0.864 smd: 1(-0.753,0) 2(0.753,0)
RES-ADJ-TH_3P-L9.5-W4.9-P2.50-L_3296W
  round 1.9 hole 0.9: 1(-2.55,0) 2(-0.01,0) 3(2.55,0)
SMA_L4.3-W2.6-LS5.2-RD
  rect 2x2 smd: 1(-2.2,0) 2(2.2,0)
SMB_L4.3-W3.6-LS5.3-RD
  rect 2.5x2.3 smd: 1(-2.15,0) 2(2.15,0)
SOIC-8_L5.0-W4.0-P1.27-LS6.0-BL-EP2.0
  oval 0.574x2.038 smd: 1(-1.905,-2.769) 2(-0.635,-2.769) 3(0.635,-2.769) 4(1.905,-2.769) 5(1.905,2.769) 6(0.635,2.769) 7(-0.635,2.769) 8(-1.905,2.769)
  rect 2x2 smd: 9(0,0)

## Nets
5V_IN: C60.2 C61.2 H4.5 H4.6 H4.7 H4.8 L5.2 R53.1
5V_IN2: C62.2 C63.2 H5.5 H5.6 H5.7 H5.8 L6.2 R52.1
5V_IN3: C64.2 C65.2 H6.5 H6.6 H6.7 H6.8 L7.2 R51.1
5V_IN4: C47.2 C48.2 H7.5 H7.6 H7.7 H7.8 L8.2 R54.1
5V_IN5: C70.2 C71.2 H9.5 H9.6 H9.7 H9.8 L10.2 R56.1
5V_IN6: C68.2 C69.2 H8.5 H8.6 H8.7 H8.8 L9.2 R55.1
GND: C14.1 C15.1 C19.2 C37.1 C38.1 C39.2 C42.1 C43.1 C44.2 C47.1 C48.1 C49.2 C52.1 C53.1 C54.2 C57.1 C58.1 C59.2 C60.1 C61.1 C62.1 C63.1 C64.1 C65.1 C66.1 C67.1 C68.1 C69.1 C70.1 C71.1 D2.2 D3.2 D4.2 D5.2 D6.2 D7.2 H4.1 H4.2 H4.3 H4.4 H5.1 H5.2 H5.3 H5.4 H6.1 H6.2 H6.3 H6.4 H7.1 H7.2 H7.3 H7.4 H8.1 H8.2 H8.3 H8.4 H9.1 H9.2 H9.3 H9.4 P1.2 R12.1 R14.1 R15.1 R18.1 R20.1 R21.1 R22.1 R24.1 R25.1 R26.1 R28.1 R29.1 R30.1 R32.1 R33.1 R34.1 R36.1 R37.1 R39.1 R41.1 R43.1 R45.1 R47.1 R49.1 U2.5 U2.9 U3.5 U3.9 U4.5 U4.9 U5.5 U5.9 U6.5 U6.9 U7.5 U7.9
VIN: C19.1 C39.1 C44.1 C49.1 C54.1 C59.1 P1.1 U8.2 U9.2 U10.2 U11.2 U12.2 U13.2
EN: R13.1 R14.2 U2.2
EN2: R19.1 R20.2 U3.2
EN3: R23.1 R24.2 U4.2
EN4: R27.1 R28.2 U5.2
EN5: R31.1 R32.2 U6.2
EN6: R35.1 R36.2 U7.2
FB: R39.2 R53.2 R53.3 U2.4
FB2: R41.2 R52.2 R52.3 U3.4
FB3: R43.2 R51.2 R51.3 U4.4
FB4: R45.2 R54.2 R54.3 U5.4
FB5: R49.2 R56.2 R56.3 U6.4
FB6: R47.2 R55.2 R55.3 U7.4
SW: C10.2 D2.1 L5.1 U2.1
SW2: C35.2 D3.1 L6.1 U3.1
SW3: C40.2 D4.1 L7.1 U4.1
SW4: C45.2 D5.1 L8.1 U5.1
SW5: C50.2 D7.1 L10.1 U6.1
SW6: C55.2 D6.1 L9.1 U7.1
$2N216: C10.1 U2.8
$2N507: R12.2 U2.6
$2N1101: C14.2 C15.2 R13.2 U2.7 U8.1
$2N1682: C13.1 R15.2
$2N1720: C13.2 U2.3
$2N9284: C35.1 U3.8
$2N9286: R18.2 U3.6
$2N9292: C36.1 R21.2
$2N9293: C36.2 U3.3
$2N9832: C40.1 U4.8
$2N9834: R22.2 U4.6
$2N9840: C41.1 R25.2
$2N9841: C41.2 U4.3
$2N10380: C45.1 U5.8
$2N10382: R26.2 U5.6
$2N10388: C46.1 R29.2
$2N10389: C46.2 U5.3
$2N10928: C50.1 U6.8
$2N10930: R30.2 U6.6
$2N10936: C51.1 R33.2
$2N10937: C51.2 U6.3
$2N11476: C55.1 U7.8
$2N11478: R34.2 U7.6
$2N11484: C56.1 R37.2
$2N11485: C56.2 U7.3
$2N16056: C37.2 C38.2 U3.7
$2N16115: C42.2 C43.2 R23.2 U4.7 U10.1
$2N16166: C52.2 C53.2 R31.2 U6.7 U11.1
$2N16216: R35.2 U12.1
$2N16265: C66.2 C67.2 U5.7
$2N116056: R19.2 U9.1
$2N116216: C57.2 C58.2 U7.7
$2N116265: R27.2 U13.1

## Via types
v1: diameter 0.61, hole 0.305, Top Layer to Bottom Layer, 20 vias

## Routing (per net, layer and track width the routed paths; a pad name or vN(x,y) marks a point on that pad's centre or on a via; arc(x,y) is an arc through that point)
5V_IN: length 38.2
  Top Layer w0.508: H4.8 H4.7 H4.6 H4.5 14.08,81.9 L5.2 14.06,74.74 C61.2 C60.2 1.08,74.74 0.64,74.29 0.64,68.2 1.78,67.06 3.29,67.06
5V_IN2: length 16.2
  Top Layer w0.508: R52.1 87.11,68.84 87.7,68.25 91.27,68.25 92.05,67.47 92.05,63.6 91.69,63.25 90.36,63.25 90.04,63.56 C63.2
5V_IN3: length 36
  Top Layer w0.508: 2.54,57.66 H6.8 ; 2.54,57.66 H6.7 H6.6 H6.5 ; 2.54,57.66 2.67,57.78 10.54,57.78 11.79,56.53 L7.2 5.59,55.88 4.57,54.86 4.57,48.89 6.73,46.74 R51.1
5V_IN4: length 21.4
  Top Layer w0.508: C48.2 92.2,39.37 92.46,39.12 93.6,39.12 93.88,39.39 93.88,45.19 93.47,45.59 85.98,45.59 85.34,46.23 85.34,49.14 R54.1
5V_IN5: length 55.4
  Top Layer w0.508: L10.2 14.52,24.19 C70.2 3.88,24.19 3.05,23.37 H9.8 H9.7 H9.6 H9.5 3.03,13.06 1.52,13.06 1.17,12.7 1.17,1.88 1.52,1.52 10.92,1.52 12.56,3.16 R56.1
5V_IN6: length 46
  Top Layer w0.508: C68.2 95.57,25.84 H8.8 H8.7 H8.5 ; C68.2 86.49,20.58 R55.1 85.97,18.12 86.71,17.38 93.18,17.38 94.11,16.45 94.11,11.73 93.58,11.2 92.69,11.2 92.58,11.3 C69.2 ; C68.2 83.4,25.84 L9.2
GND: length 366.1
  Top Layer w0.508: 86.31,30.15 86.49,29.97 C68.1 ; 86.31,30.15 86.64,30.48 98.68,30.48 99.04,30.12 99.04,19.54 96.52,17.02 ; 86.31,30.15 86,30.46 74.02,30.46 73.66,30.1 73.66,23.96 D6.2 ; U5.5 79.63,40.13 78.22,41.54 ; 21.33,49.28 22.73,47.88 23.6,47.88 ; H8.4 H8.2 H8.1 ; D3.2 74.08,72.73 72.14,74.68 72.14,81.15 72.9,81.91 83.69,81.91 H5.4 83.82,83.82 84.46,84.45 96.14,84.45 96.65,83.95 96.65,79.25 95.76,78.36 C62.1 ; D7.2 v1(19.24,28.11) 17.95,28.11 16.64,26.8 16.64,20.95 13.6,17.92 ; U6.9 25.02,13.21 25.65,12.57 U6.5 27.93,12.43 ; C65.1 C64.1 13.65,59.25 14.69,60.28 D4.2 22.5,60.28 v1(22.5,60.28) ; 19.28,67.06 18.42,67.06 17.01,68.46 ; 10.45,17.85 10.51,17.92 13.6,17.92 ; 10.45,17.85 10.45,22.78 10.46,22.79 ; 10.45,17.85 R49.1 10.45,15.75 5.24,10.54 H9.4 H9.3 H9.2 H9.1 ; D2.2 22.77,79.16 24.77,81.15 24.77,83.57 24.13,84.2 12.45,84.2 11.94,83.69 H4.4 ; R43.1 R25.1 ; H4.4 11.94,76.26 C61.1 C60.1 4,76.14 3.94,76.2 ; H4.4 H4.3 H4.2 H4.1 ; R39.1 3.17,73.4 3.43,73.66 v1(3.94,73.66) 4.44,73.66 4.71,73.4 R15.1 ; 10.46,22.79 C71.1 ; 10.46,22.79 C70.1 ; 13.6,17.92 R33.1 ; 27.93,12.43 32.8,12.43 C52.1 C53.1 ; 27.93,12.43 R32.1 ; H6.1 H6.2 H6.3 H6.4 ; U3.5 78.83,63.92 77.42,65.32 ; U7.5 80.01,13.21 79.65,13.57 79.65,14.52 79.75,14.61 ; C47.1 88.06,57.15 90.34,59.44 98.3,59.44 99.25,58.48 99.25,47.69 98.68,47.12 H7.4 H7.3 H7.2 H7.1
  Bottom Layer w0.508: v1(3.94,73.66) v1(3.94,76.14) 6.28,78.49 15.75,78.49 16.51,77.72 16.51,69.96 16.01,69.46 ; v1(22.5,60.28) 21.21,58.98 21.21,51.16 20.33,50.28 ; 76.42,65.32 77.42,65.32
  Bottom Layer w1.27: 17.01,69.46 16.26,68.71 16.26,62.99 17.02,62.23 22.5,62.23 ; 22.5,62.23 30.73,62.23 34.67,66.17 40,66.17 ; 22.5,62.23 v1(22.5,60.28)
  vias: v1(82.58,64.01) v1(83.51,64.01) v1(84.51,64.01) v1(84.71,40) v1(85.42,64.01) v1(85.64,40) v1(86.33,64.01) v1(86.64,40) v1(87.55,40) v1(88.46,40)
VIN: length 27.2
  Top Layer w1.27: C19.1 37.84,73.28 U8.2 ; U11.2 C54.1 ; U10.2 38.09,55.75 C44.1
EN: length 8.8
  Top Layer w0.254: R13.1 R14.2 17.53,65.15 15.11,67.56 15.11,69.21 14.73,69.6 U2.2
EN2: length 4.5
  Top Layer w0.254: 71.58,67.73 71.58,67.63 72.75,66.46 ; 71.58,65.95 72.09,66.46 72.75,66.46 ; 72.75,66.46 U3.2
EN3: length 9.6
  Top Layer w0.254: 22.43,44.32 22.43,45.96 ; R24.2 20.07,45.97 19.43,46.61 19.43,49.66 18.67,50.42 U4.2
EN4: length 6.2
  Top Layer w0.254: 74.96,42.67 73.15,42.67 73.15,43.18 ; R28.2 73.15,43.18 ; 73.15,43.18 73.15,44.58 72.77,44.96 72,44.96 R27.1
EN5: length 10.5
  Top Layer w0.254: 26.42,8 R32.2 24.13,9.65 23.62,10.16 23.62,14.22 22.73,15.11 U6.2
EN6: length 5.7
  Top Layer w0.508: 76.48,15.75 R35.1 R36.2
FB: length 22.1
  Top Layer w0.508: R39.2 1.66,71.11 2.67,70.1 5.08,70.1 5.83,69.35 5.83,65.92 6.6,65.15 10.41,65.15 11.17,65.9 11.17,67.06 ; 13.74,67.06 11.17,67.06 ; 11.17,67.06 8.39,67.06
FB2: length 62.8
  Top Layer w0.508: 95.61,70.87 95.61,73.17 95.12,73.66 90.17,73.66 89.65,73.14 R52.2 93.09,68.44 93.09,62.99 92.58,62.48 88.77,62.48 88.14,63.12 R41.2 ; 95.61,70.87 94.59,71.88 R52.3 ; 95.61,70.87 95.61,62.99 94.21,61.59 75.56,61.59 74.17,62.99 74.17,63.91 U3.4
FB3: length 23.5
  Top Layer w0.508: U4.4 17.33,47.88 16.51,47.06 16.51,44.2 16.15,43.84 13.12,43.84 ; 13.12,43.84 11.41,43.84 10.53,44.71 10.53,48.65 9.91,49.28 7.85,49.28 6.1,51.02 R43.2 ; 13.12,43.84 13.12,46.71 R51.3
FB4: length 67.1
  Top Layer w0.508: 90.43,51.1 90.42,51.12 87.88,51.12 87.87,51.11 R54.2 90.54,46.48 93.98,46.48 94.49,45.97 94.49,38.73 94.13,38.38 90.68,38.38 90.32,38.73 90.32,41.04 90.42,41.15 ; 90.43,51.1 91.9,51.1 95.38,47.62 95.38,38.48 94.23,37.34 76.07,37.34 74.96,38.46 74.96,40.13 ; 90.43,51.1 R54.3
FB5: length 24.1
  Top Layer w0.508: 18.2,8 21.72,8 22.25,8.53 U6.4 ; 18.2,8 17.66,8.54 R56.3 ; 18.2,8 15.24,8 15.1,8.14 R56.2 15.1,12.46 13.46,14.1 12.31,14.1 11.95,14.46 R49.2
FB6: length 63.2
  Top Layer w0.508: 91.31,21.84 90.95,21.48 90.95,20.18 91.07,20.07 ; 91.31,21.84 88.9,21.84 88.51,21.45 R55.2 90.59,17.99 93.65,17.99 94.74,16.89 94.74,11.18 93.85,10.29 91.06,10.29 90.68,10.67 R47.2 ; 91.31,21.84 93.09,21.84 95.75,19.19 95.75,10.15 94.74,9.14 77.98,9.14 76.48,10.64 76.48,13.21
SW5: length 16.3
  Top Layer w0.508: L10.1 23.45,23.75 D7.1 26.39,20.82 C50.2 23.62,19.81 22.25,18.44 U6.1
$2N216: length 7.8
  Top Layer w0.508: 24.64,73.53 21.97,70.87 U2.8 ; 24.64,73.53 24.64,74.74 ; 24.64,73.53 24.64,73.41
$2N507: length 2.6
  Top Layer w0.508: 21.84,68.33 U2.6
$2N1101: length 15.8
  Top Layer w0.508: C15.2 27.24,69.91 28.07,69.09 28.07,64.77 26.67,63.37 R13.2
$2N1682: length 2
  Top Layer w0.508: R15.2 C13.1
$2N1720: length 7.6
  Top Layer w0.508: U2.3 11.93,68.33 11.56,68.7 11.56,71.75 10.92,72.39 C13.2
$2N9284: length 2.1
  Top Layer w0.508: 79.69,67.73 C35.1
$2N9286: length 9.8
  Top Layer w0.508: v1(81.08,65.21) 79.71,65.21 U3.6 ; v1(86.2,67.71) 86.2,66.58
  Bottom Layer w0.508: v1(86.2,67.71) 81.73,67.71 81.08,67.06 v1(81.08,65.21)
$2N9292: length 2.5
  Top Layer w0.508: R21.2 70.04,62.94 C36.1
$2N9293: length 4.9
  Top Layer w0.508: C36.2 72.01,62.48 72.52,62.99 72.52,64.77 72.94,65.19 U3.3
$2N9832: length 4.2
  Top Layer w0.508: 23.6,51.69 23.6,55.88
$2N9834: length 2.2
  Top Layer w0.508: 23.6,49.15 25.79,49.15
$2N9840: length 2.1
  Top Layer w0.508: R25.2 C41.1
$2N9841: length 4.7
  Top Layer w0.508: U4.3 16.89,49.15 15.88,50.16 15.88,50.8 15.62,51.05 C41.2
$2N10380: length 2.2
  Top Layer w0.508: C45.1 80.49,46.14 U5.8
$2N10382: length 10.7
  Top Layer w0.508: R26.2 v1(88.65,44.05) ; v1(81.91,41.4) U5.6
  Bottom Layer w0.508: v1(88.65,44.05) 88.63,44.07 84.46,44.07 81.91,41.53 v1(81.91,41.4)
$2N10388: length 2.5
  Top Layer w0.508: R29.2 70.55,39.95 C46.1
$2N10389: length 4.6
  Top Layer w0.508: C46.2 73.15,39.5 73.28,39.62 73.28,41.02 73.66,41.4 74.96,41.4
$2N10928: length 3.4
  Top Layer w0.508: C50.1 U6.8
$2N10930: length 2.9
  Top Layer w0.508: U6.6 R30.2
$2N10936: length 1.6
  Top Layer w0.508: R33.2 C51.1
$2N10937: length 4.9
  Top Layer w0.508: U6.3 20,13.84 C51.2
$2N11476: length 2.1
  Top Layer w0.508: C55.1 82.04,17.04 U7.8
$2N11478: length 7.7
  Top Layer w0.508: R34.2 v1(88.77,14.62) ; 82.02,14.48 83.69,14.48 v1(83.82,14.6)
  Bottom Layer w0.508: v1(83.82,14.6) 83.83,14.62 v1(88.77,14.62)
$2N11484: length 2.6
  Top Layer w0.508: R37.2 70.93,10.87 C56.1
$2N11485: length 7.1
  Top Layer w0.508: C56.2 72.52,10.29 73.91,11.68 73.91,13.72 74.68,14.48 76.48,14.48
$2N16056: length 4.5
  Top Layer w0.508: U3.7 84.1,66.46 84.16,66.52
$2N16115: length 28.9
  Top Layer w0.508: C43.2 31.5,50.42 32.64,49.28 32.64,45.72 31.23,44.31 R23.2 ; 23.6,50.42 C42.2
  Top Layer w1.27: U10.1 26.81,53.58 28.19,52.2 ; 28.19,52.2 28.19,50.45 ; 28.19,52.2 29.94,50.45
$2N16166: length 39.5
  Top Layer w0.508: U11.1 27.69,23.87 33.14,18.42 ; 33.14,18.42 32.89,18.18 C52.2 31.52,15.11 U6.7 ; 33.14,18.42 35.18,16.38 C53.2 ; 35.18,13.72 36.45,13.72 36.96,13.21 36.96,10.29 34.54,7.87 R31.2
$2N16216: length 0.7
  Top Layer w0.508: 70.87,25.29 U12.1
$2N16265: length 6.3
  Top Layer w0.508: C67.2 86.61,42.67 U5.7
$2N116216: length 6.6
  Top Layer w0.508: U7.7 84.2,15.75 84.65,15.3 C57.2 86.68,13.59 C58.2

## Copper pours and planes (outline as drawn; the poured copper is in the pictures)
5V_IN2 on Top Layer: 81.53,82.8 95,82.8 95,70.61 81.53,70.61
5V_IN4 on Top Layer: 82.38,58.8 98.04,58.8 98.04,47.88 82.38,47.88
GND on Top Layer: 23.23,49.67 31.04,49.67 31.04,45.33 23.23,45.33
GND on Top Layer: 58.36,20.57 62.04,20.57 62.04,14.22 58.36,14.22
GND on Top Layer: 58.23,14.85 71.56,14.85 71.56,11.32 58.23,11.32
GND on Top Layer: 80.75,16.52 93.07,16.52 93.07,11.44 80.75,11.44
GND on Top Layer: 58.55,49.91 62.23,49.91 62.23,43.56 58.55,43.56
GND on Top Layer: 0,85.27 100,85.27 100,0 0,0
GND on Top Layer: 78.74,67.44 90.81,67.44 90.81,63.63 78.74,63.63
GND on Top Layer: 79.39,43.47 93.23,43.47 93.23,39.66 79.39,39.66
GND on Top Layer: 18.57,69.04 27.18,69.04 27.18,64.45 18.57,64.45
GND on Top Layer: 58.8,66.95 70.87,66.95 70.87,63.42 58.8,63.42
GND on Top Layer: 59.25,43.93 71.31,43.93 71.31,40.4 59.25,40.4
GND on Bottom Layer: 0,85.27 100,85.27 100,0 0,0
VIN on Top Layer: 58.86,76.2 67.63,76.2 67.63,70.36 58.86,70.36
VIN on Top Layer: 33.6,85.27 33.6,0.08 65.53,-0.13 65.79,0.13 65.79,85.09 65.66,85.22 33.65,85.22
VIN on Top Layer: 58.73,57.53 68.9,57.53 68.9,51.69 58.73,51.69
VIN on Top Layer: 58.79,29.21 68.97,29.21 68.97,23.37 58.79,23.37
SW on Top Layer: 12.45,77.72 25.42,77.72 25.42,70.36 12.45,70.36
SW2 on Top Layer: 72.69,80.01 80.32,80.01 80.32,74.8 72.69,74.8
SW2 on Top Layer: 72.77,78.36 80.62,78.36 80.62,67.18 72.77,67.18
SW3 on Top Layer: 14.73,57.78 22.99,57.78 22.99,51.31 14.73,51.31
SW4 on Top Layer: 74,58.76 81.02,58.76 81.02,53.55 74,53.55
SW4 on Top Layer: 73.67,57.53 81.4,57.53 81.4,43.31 73.67,43.31
SW5 on Top Layer: 17.72,25.08 26.8,25.08 26.8,16.05 17.72,16.05
SW6 on Top Layer: 75.13,23.26 82.6,23.26 82.6,16.64 75.13,16.64
SW6 on Top Layer: 74.7,28.51 81.72,28.51 81.72,23.05 74.7,23.05
$2N1101 on Top Layer: 19.06,75.02 28.49,75.02 28.49,69.36 19.06,69.36
$2N10928 on Top Layer: 27.09,22.63 32.38,22.63 32.38,15.88 27.09,15.88
$2N16216 on Top Layer: 69.82,27.42 73.05,27.42 73.05,15.26 69.82,15.26
$2N116056 on Top Layer: 68.65,75.56 71.63,75.56 71.63,67.21 68.65,67.21
$2N116265 on Top Layer: 69.5,56.5 73.12,56.5 73.12,44.34 69.5,44.34

## Text on the board
Bottom Silkscreen Layer: 浙江师范大学行知学院2025
